# Altium project Wifi_Scan1.PrjPcb
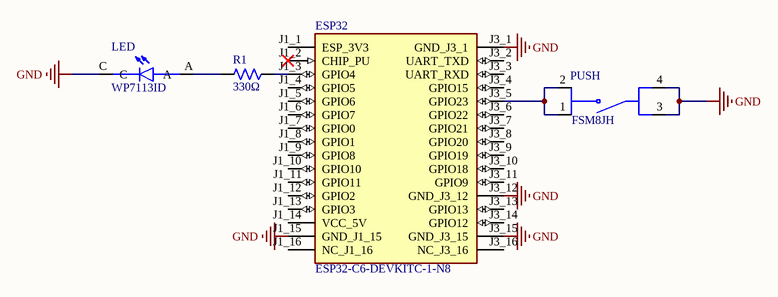
[diagram p0: main_schematic.SchDoc]
1 sheet, 4 parts. Net scope: global (net labels, ports and power ports of the same name join across sheets).
Board file: WifiScan_PCB.PcbDoc

## Sheet main_schematic.SchDoc: WifiMapper Circuit
size A4; Date: 18/04/2026; DrawnBy: Group6 ISS396; Revision: v1.0; SheetNumber: 1; SheetTotal: 1

### Parts
ESP32  ESP32-C6-DEVKITC-1-N8  [MODULE_ESP32-C6-DEVKITC-1-N8]
LED  WP7113ID  [LED_WP7113ID]
PUSH  FSM8JH  [SW_FSM8JH]
R1  330Ω  [RESAD730W45L370D210]

### Nets
GND: ESP32.J1_15(GND_J1_15) ESP32.J3_1(GND_J3_1) ESP32.J3_12(GND_J3_12) ESP32.J3_15(GND_J3_15) LED.C PUSH.3(COM_3) PUSH.4(COM_4)
NetESP32_J1_3: ESP32.J1_3(GPIO4) R1.2
NetESP32_J3_5: ESP32.J3_5(GPIO23) PUSH.1(NO_1) PUSH.2(NO_2)
NetLED_A: LED.A R1.1

Not connected (* = marked no-connect by the designer): ESP32 J1_1(ESP_3V3) J1_2(CHIP_PU)* J1_4(GPIO5) J1_5(GPIO6) J1_6(GPIO7) J1_7(GPIO0) J1_8(GPIO1) J1_9(GPIO8) J1_10(GPIO10) J1_11(GPIO11) J1_12(GPIO2) J1_13(GPIO3) J1_14(VCC_5V) J1_16(NC_J1_16) J3_2(UART_TXD) J3_3(UART_RXD) J3_4(GPIO15) J3_6(GPIO22) J3_7(GPIO21) J3_8(GPIO20) J3_9(GPIO19) J3_10(GPIO18) J3_11(GPIO9) J3_13(GPIO13) J3_14(GPIO12) J3_16(NC_J3_16)

### Library data of the parts
ESP32 = ESP32-C6-DEVKITC-1-N8: The ESP32-C6-DEVKITC-1-N8 from Espressif Systems is a development board designed for RF, RFID, and wireless applications. Built around the ESP32-C6-WROOM-1 module, it supports multiple connectivity options including 802.11 b/g/n/ax Wi-Fi, BluetoothÂ® (BLE; SnapEDA_Link: https://www.snapeda.com/parts/ESP32-C6-DEVKITC-1-N8/Espressif+Systems/view-part/?ref=snap; Package: None; Value: *; MF: Espressif Systems; MP: ESP32-C6-DEVKITC-1-N8; Check_prices: https://www.snapeda.com/parts/ESP32-C6-DEVKITC-1-N8/Espressif+Systems/view-part/?ref=eda
LED = WP7113ID: Red 617nm LED Indication - Discrete 2V Radial; MF: Kingbright; Price: None; MP: WP7113ID; Package: Radial Kingbright; Check_prices: https://www.snapeda.com/parts/WP7113ID/Kingbright/view-part/?ref=eda; Purchase-URL: https://pricing.snapeda.com/search/part/WP7113ID/?ref=eda; Availability: In Stock; Value: *; SnapEDA_Link: https://www.snapeda.com/parts/WP7113ID/Kingbright/view-part/?ref=snap
PUSH = FSM8JH: Switch,Pushbutton,Tactile,SPST,Thru Hole,Vertical,6MM,Black | TE Connectivity FSM8JH; SnapEDA_Link: https://www.snapeda.com/parts/FSM8JH/TE+Connectivity+ALCOSWITCH+Switches/view-part/?ref=snap; Package: None; Value: *; MF: TE Connectivity; MP: FSM8JH; Check_prices: https://www.snapeda.com/parts/FSM8JH/TE+Connectivity+ALCOSWITCH+Switches/view-part/?ref=eda
R1 = MFR-12FRF52-330R: MFR Series, Watts 1/6 Â±1% Tolerance, Â±100 ppm/C TCR, Resistance 330R Tape/Reel; MF: YAGEO; SnapEDA_Link: https://www.snapeda.com/parts/MFR-12FRF52-330R/Yageo/view-part/?ref=snap; Package: RADIAL-2 Yageo; Value: *; MP: MFR-12FRF52-330R; Check_prices: https://www.snapeda.com/parts/MFR-12FRF52-330R/Yageo/view-part/?ref=eda